# Altium project IoT_SYNTHPATCH_ANALOG.PrjPcb
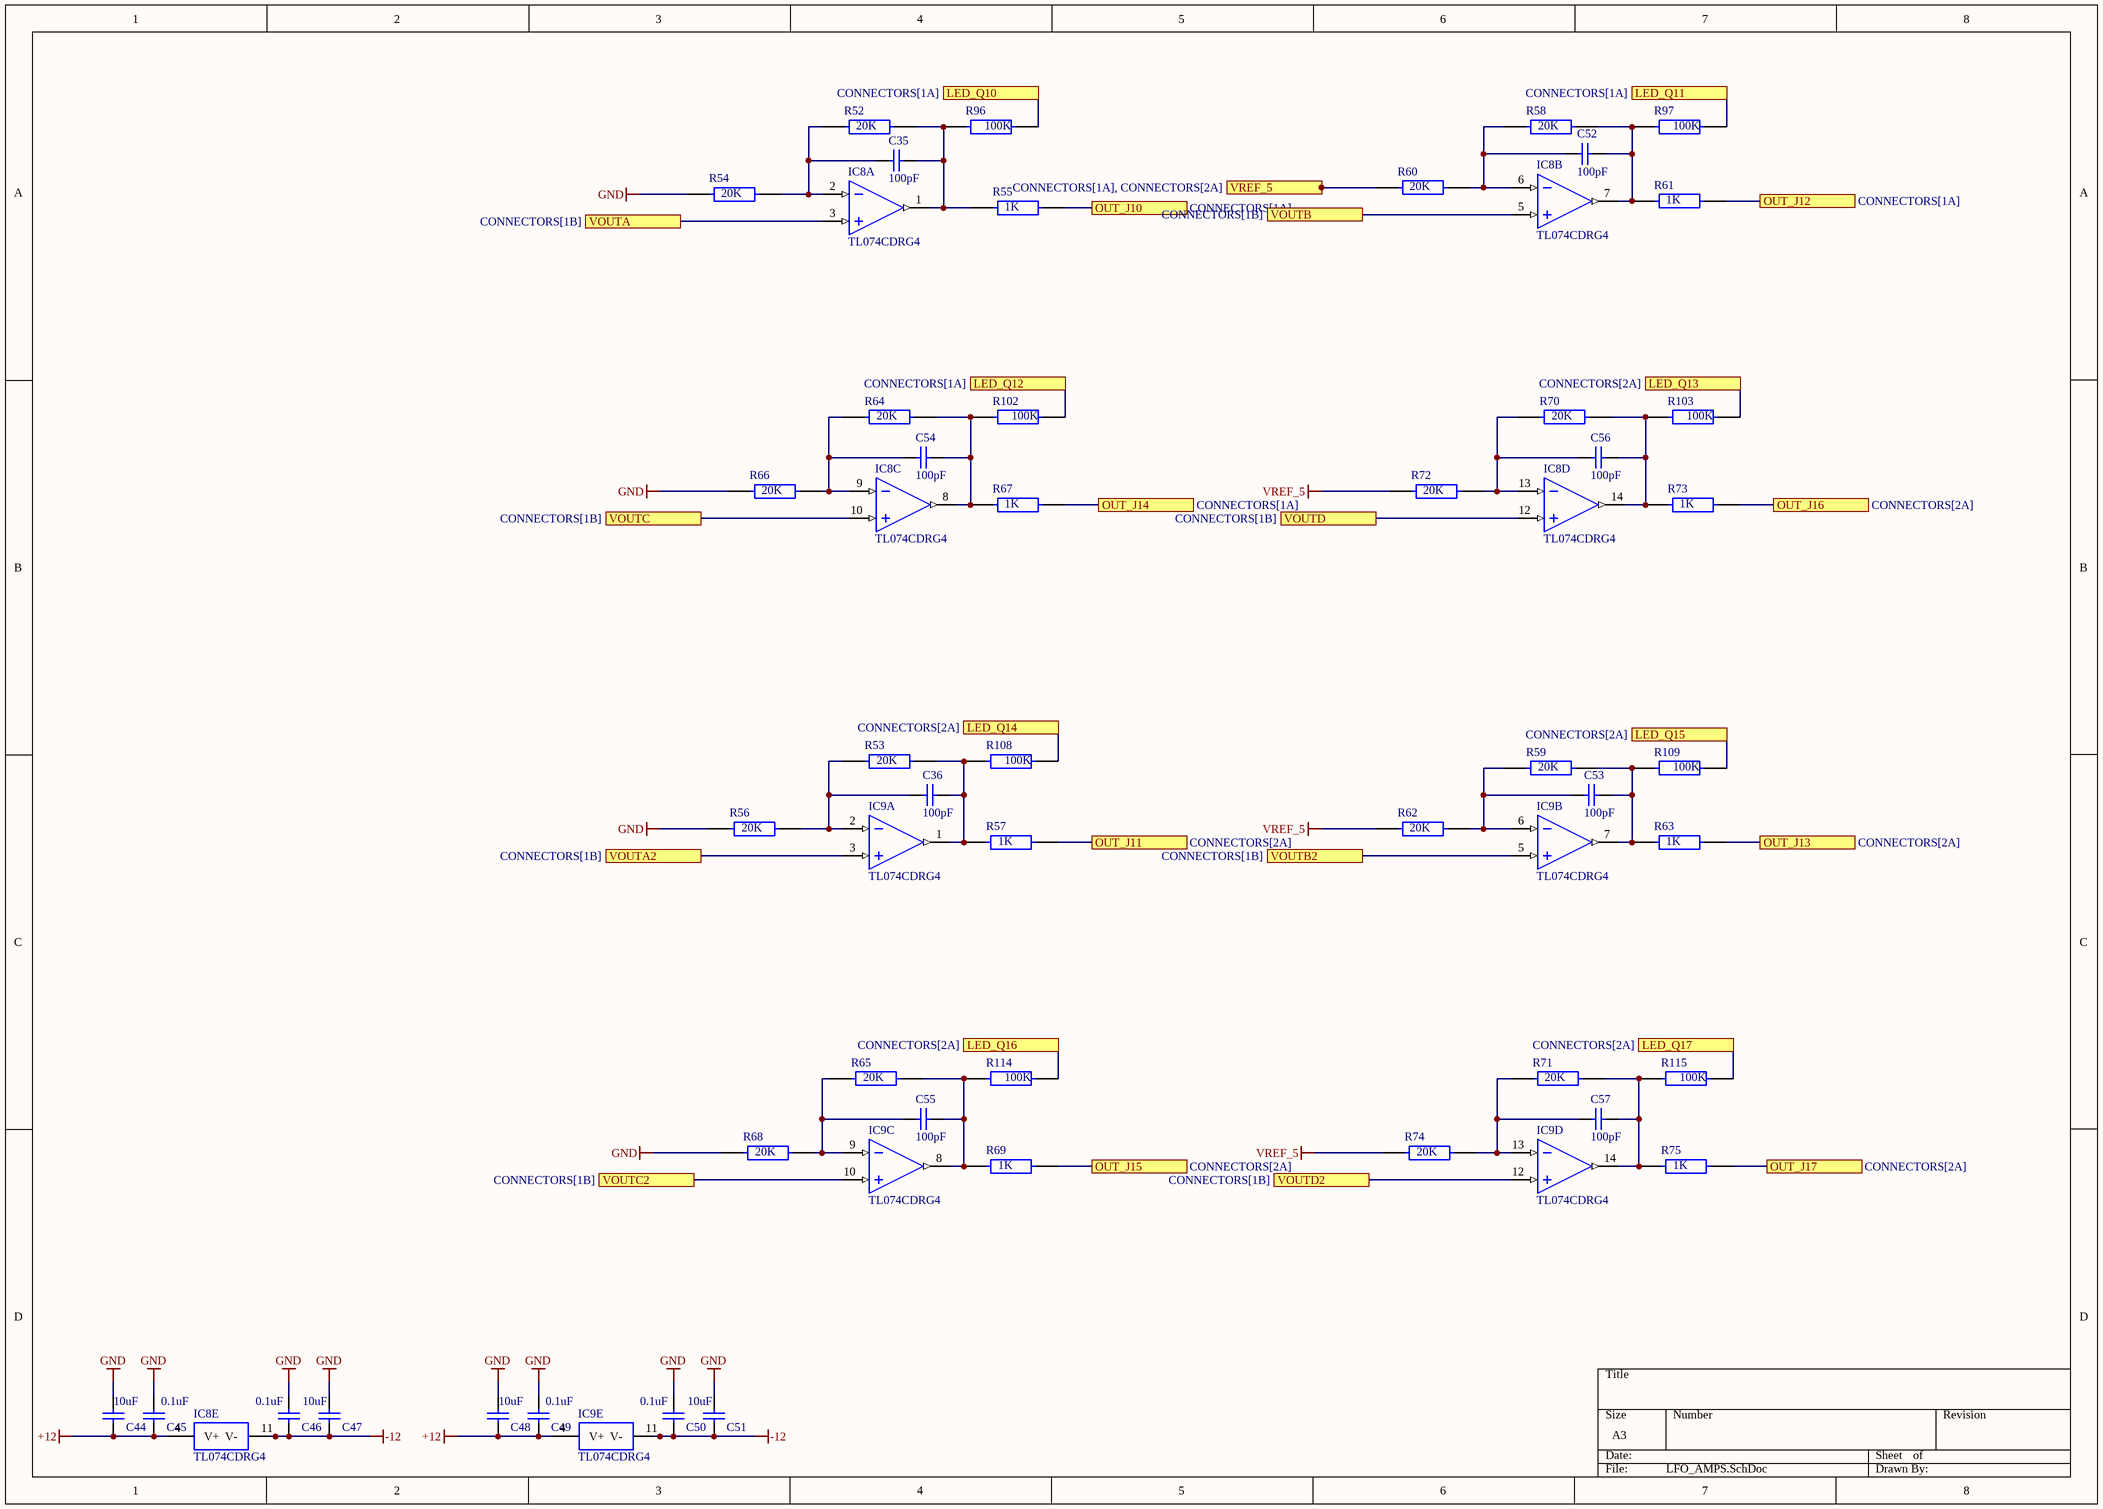
[diagram p0: LFO_AMPS.SchDoc]
8 sheets, 165 parts. Net scope: flat (ports and power ports of the same name join across sheets).
Board file: IoT_SYNTHPATCH_ANALOG.PcbDoc
Sheets:
  LFO_AMPS.SchDoc
  VOCT_AMPS.SchDoc
  ADC_AMPS.SchDoc
  CONNECTORS.SchDoc
  INPUTS_GATES_A.SchDoc
  MENU_BUTTONS_A.SchDoc
  MUTE_BUTTONS_A.SchDoc
  ADC_A.SchDoc

## Sheet LFO_AMPS.SchDoc
size A3; SheetNumber: 1; SheetTotal: 8

### Parts
C35  100pF  [CAPC2013X145X48NL20T23]
C36  100pF  [CAPC2013X145X48NL20T23]
C44  10uF  [CAPC2013X145X48NL20T23]
C45  0.1uF  [CAPC2013X145X48NL20T23]
C46  0.1uF  [CAPC2013X145X48NL20T23]
C47  10uF  [CAPC2013X145X48NL20T23]
C48  10uF  [CAPC2013X145X48NL20T23]
C49  0.1uF  [CAPC2013X145X48NL20T23]
C50  0.1uF  [CAPC2013X145X48NL20T23]
C51  10uF  [CAPC2013X145X48NL20T23]
C52  100pF  [CAPC2013X145X48NL20T23]
C53  100pF  [CAPC2013X145X48NL20T23]
C54  100pF  [CAPC2013X145X48NL20T23]
C55  100pF  [CAPC2013X145X48NL20T23]
C56  100pF  [CAPC2013X145X48NL20T23]
C57  100pF  [CAPC2013X145X48NL20T23]
IC8  TL074CDRG4  [tl074]  (parts A,B,C,D,E of 5)
IC9  TL074CDRG4  [tl074]  (parts A,B,C,D,E of 5)
R52  20K  [FP-RN73R2A-IPC_A]
R53  20K  [FP-RN73R2A-IPC_A]
R54  20K  [FP-RN73R2A-IPC_A]
R55  1K  [FP-RN73R2A-IPC_A]
R56  20K  [FP-RN73R2A-IPC_A]
R57  1K  [FP-RN73R2A-IPC_A]
R58  20K  [FP-RN73R2A-IPC_A]
R59  20K  [FP-RN73R2A-IPC_A]
R60  20K  [FP-RN73R2A-IPC_A]
R61  1K  [FP-RN73R2A-IPC_A]
R62  20K  [FP-RN73R2A-IPC_A]
R63  1K  [FP-RN73R2A-IPC_A]
R64  20K  [FP-RN73R2A-IPC_A]
R65  20K  [FP-RN73R2A-IPC_A]
R66  20K  [FP-RN73R2A-IPC_A]
R67  1K  [FP-RN73R2A-IPC_A]
R68  20K  [FP-RN73R2A-IPC_A]
R69  1K  [FP-RN73R2A-IPC_A]
R70  20K  [FP-RN73R2A-IPC_A]
R71  20K  [FP-RN73R2A-IPC_A]
R72  20K  [FP-RN73R2A-IPC_A]
R73  1K  [FP-RN73R2A-IPC_A]
R74  20K  [FP-RN73R2A-IPC_A]
R75  1K  [FP-RN73R2A-IPC_A]
R96  100K  [FP-RN73R2A-IPC_A]
R97  100K  [FP-RN73R2A-IPC_A]
R102  100K  [FP-RN73R2A-IPC_A]
R103  100K  [FP-RN73R2A-IPC_A]
R108  100K  [FP-RN73R2A-IPC_A]
R109  100K  [FP-RN73R2A-IPC_A]
R114  100K  [FP-RN73R2A-IPC_A]
R115  100K  [FP-RN73R2A-IPC_A]

### Ports
LED_Q10 (see CONNECTORS[1A]), LED_Q11 (see CONNECTORS[1A]), LED_Q12 (see CONNECTORS[1A]), LED_Q13 (see CONNECTORS[2A]), LED_Q14 (see CONNECTORS[2A]), LED_Q15 (see CONNECTORS[2A]), LED_Q16 (see CONNECTORS[2A]), LED_Q17 (see CONNECTORS[2A]), OUT_J10 (see CONNECTORS[1A]), OUT_J11 (see CONNECTORS[2A]), OUT_J12 (see CONNECTORS[1A]), OUT_J13 (see CONNECTORS[2A]), OUT_J14 (see CONNECTORS[1A]), OUT_J15 (see CONNECTORS[2A]), OUT_J16 (see CONNECTORS[2A]), OUT_J17 (see CONNECTORS[2A]), VOUTA2 (see CONNECTORS[1B]), VOUTA (see CONNECTORS[1B]), VOUTB2 (see CONNECTORS[1B]), VOUTB (see CONNECTORS[1B]), VOUTC2 (see CONNECTORS[1B]), VOUTC (see CONNECTORS[1B]), VOUTD2 (see CONNECTORS[1B]), VOUTD (see CONNECTORS[1B]), VREF_5 (see CONNECTORS[1A], CONNECTORS[2A])

### Nets
+12: C44.1 C45.1 C48.1 C49.1 IC8.4(V+) IC9.4(V+)
-12: C46.1 C47.1 C50.1 C51.1 IC8.11(V-) IC9.11(V-)
GND: C44.2 C45.2 C46.2 C47.2 C48.2 C49.2 C50.2 C51.2 R54.1 R56.1 R66.1 R68.1
VREF_5: R60.1 R62.1 R72.1 R74.1 ; port VREF_5
LED_Q10: R96.1 ; port LED_Q10
LED_Q11: R97.1 ; port LED_Q11
LED_Q12: R102.1 ; port LED_Q12
LED_Q13: R103.1 ; port LED_Q13
LED_Q14: R108.1 ; port LED_Q14
LED_Q15: R109.1 ; port LED_Q15
LED_Q16: R114.1 ; port LED_Q16
LED_Q17: R115.1 ; port LED_Q17
OUT_J10: R55.2 ; port OUT_J10
OUT_J11: R57.2 ; port OUT_J11
OUT_J12: R61.2 ; port OUT_J12
OUT_J13: R63.2 ; port OUT_J13
OUT_J14: R67.2 ; port OUT_J14
OUT_J15: R69.2 ; port OUT_J15
OUT_J16: R73.2 ; port OUT_J16
OUT_J17: R75.2 ; port OUT_J17
VOUTA: IC8.3(IN1+) ; port VOUTA
VOUTA2: IC9.3(IN1+) ; port VOUTA2
VOUTB: IC8.5(IN2+) ; port VOUTB
VOUTB2: IC9.5(IN2+) ; port VOUTB2
VOUTC: IC8.10(IN3+) ; port VOUTC
VOUTC2: IC9.10(IN3+) ; port VOUTC2
VOUTD: IC8.12(IN4+) ; port VOUTD
VOUTD2: IC9.12(IN4+) ; port VOUTD2
NetC35_1: C35.1 IC8.1(OUT1) R52.2 R55.1 R96.2
NetC35_2: C35.2 IC8.2(IN1-) R52.1 R54.2
NetC36_1: C36.1 IC9.1(OUT1) R53.2 R57.1 R108.2
NetC36_2: C36.2 IC9.2(IN1-) R53.1 R56.2
NetC52_1: C52.1 IC8.7(OUT2) R58.2 R61.1 R97.2
NetC52_2: C52.2 IC8.6(IN2-) R58.1 R60.2
NetC53_1: C53.1 IC9.7(OUT2) R59.2 R63.1 R109.2
NetC53_2: C53.2 IC9.6(IN2-) R59.1 R62.2
NetC54_1: C54.1 IC8.8(OUT3) R64.2 R67.1 R102.2
NetC54_2: C54.2 IC8.9(IN3-) R64.1 R66.2
NetC55_1: C55.1 IC9.8(OUT3) R65.2 R69.1 R114.2
NetC55_2: C55.2 IC9.9(IN3-) R65.1 R68.2
NetC56_1: C56.1 IC8.14(OUT4) R70.2 R73.1 R103.2
NetC56_2: C56.2 IC8.13(IN4-) R70.1 R72.2
NetC57_1: C57.1 IC9.14(OUT4) R71.2 R75.1 R115.2
NetC57_2: C57.2 IC9.13(IN4-) R71.1 R74.2

### Library data of the parts
C35 C36 C44-C57 = CAP: Manufacturer: Vitramon; Part Number: VJ0805Y682KXAMT
IC8 IC9 = tl074: Quad Low-Noise JFET-Input General-Purpose Operational Amplifier, 7 to 36 V, 0 to 70 degC, 14-pin SOIC (D14), Green (RoHS & no Sb/Br); Manufacturer: Texas Instruments; GBW(Typ)(MHz): 3; Sub Family: General Purpose Amplifier, High Supply Voltage Amplifier (>=30V); Vn at 1kHz(Typ)(nV/rtHz): 18; Rating: Military; Total Supply Voltage(Min)(+5V is 5, +/-5V is 10): 7; IIB(Max)(pA): 200; CMRR(Min)(dB): 70; Number of Channels: 4; Vio (25C)(Max)(mV): 10; Slew Rate(Typ)(V/us): 13; Iq per channel(Max)(mA): 2.5; Total Supply Voltage(Max)(+5V is 5, +/-5V is 10): 36; ComponentLink2URL: http://www.ti.com/lit/ds/symlink/tl074.pdf; ComponentLink3Description: Package Specification; PackageReference: D0014A; ComponentLink1URL: http://www.ti.com/; PartNumber: TL074CDRG4; PackageVersion: 4040047-5/M, 06/2011; Eco-Plan: Green (RoHS & no Sb/Br); PackageDescription: 14-Pin Plastic Small Outline, Body 8.65 x 3.90 mm, Pitch 1.27 mm; Mounting Technology: Surface Mount; ComponentLink1Description: Manufacturer URL; Offset Drift(Typ)(uV/C): 18; ComponentLink3URL: http://www.ti.com/lit/ml/mpds177g/mpds177g.pdf; ComponentLink2Description: Datasheet; DatasheetVersion: SLOS080J; Code_JEDEC: MS-012
R52-R75 R96 R97 R102 R103 R108 R109 R114 R115 = Resistor: RES 10K OHM 0.1% 1/8W 0805

## Sheet VOCT_AMPS.SchDoc
size A4; SheetNumber: 2; SheetTotal: 4
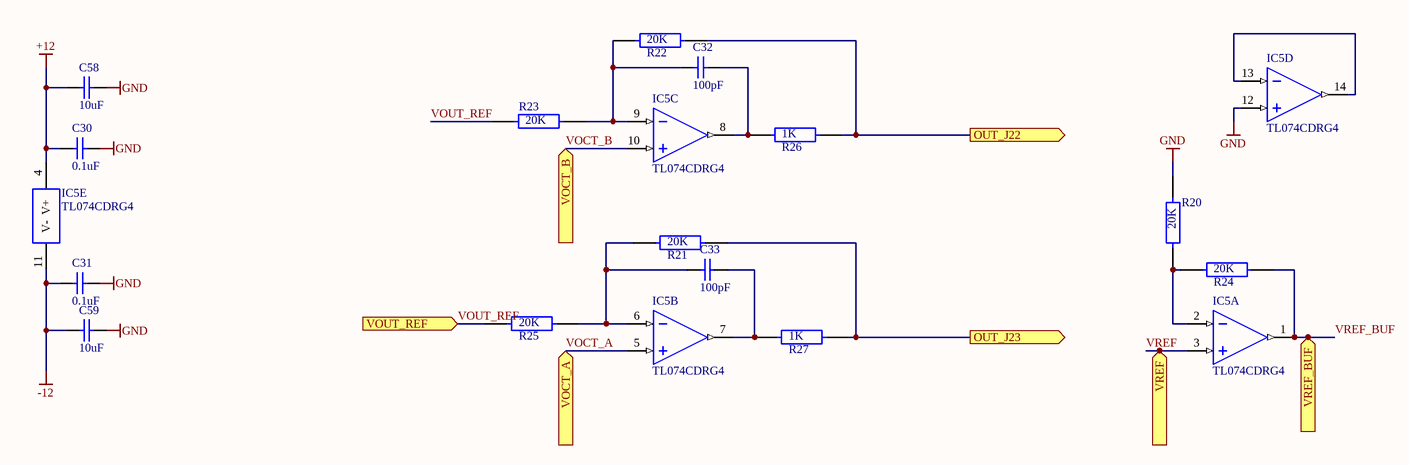
[diagram p1: VOCT_AMPS.SchDoc]

### Parts
C30  0.1uF  [CAPC2013X145X48NL20T23]
C31  0.1uF  [CAPC2013X145X48NL20T23]
C32  100pF  [CAPC2013X145X48NL20T23]
C33  100pF  [CAPC2013X145X48NL20T23]
C58  10uF  [CAPC2013X145X48NL20T23]
C59  10uF  [CAPC2013X145X48NL20T23]
IC5  TL074CDRG4  [tl074]  (parts A,B,C,D,E of 5)
R20  20K  [FP-RN73R2A-IPC_A]
R21  20K  [FP-RN73R2A-IPC_A]
R22  20K  [FP-RN73R2A-IPC_A]
R23  20K  [FP-RN73R2A-IPC_A]
R24  20K  [FP-RN73R2A-IPC_A]
R25  20K  [FP-RN73R2A-IPC_A]
R26  1K  [FP-RN73R2A-IPC_A]
R27  1K  [FP-RN73R2A-IPC_A]

### Ports
OUT_J22, OUT_J23, VOCT_A, VOCT_B, VOUT_REF, VREF, VREF_BUF

### Nets
+12: C30.2 C58.2 IC5.4(V+)
-12: C31.2 C59.2 IC5.11(V-)
GND: C30.1 C31.1 C58.1 C59.1 IC5.12(IN4+) R20.1
OUT_J22: R22.1 R26.1 ; port OUT_J22
OUT_J23: R21.1 R27.1 ; port OUT_J23
VOCT_A: IC5.5(IN2+) ; port VOCT_A
VOCT_B: IC5.10(IN3+) ; port VOCT_B
VOUT_REF: R23.1 R25.2 ; port VOUT_REF
VREF: IC5.3(IN1+) ; port VREF
VREF_BUF: IC5.1(OUT1) R24.1 ; port VREF_BUF
NetC32_1: C32.1 IC5.8(OUT3) R26.2
NetC32_2: C32.2 IC5.9(IN3-) R22.2 R23.2
NetC33_1: C33.1 IC5.7(OUT2) R27.2
NetC33_2: C33.2 IC5.6(IN2-) R21.2 R25.1
NetIC5_2: IC5.2(IN1-) R20.2 R24.2
NetIC5_13: IC5.13(IN4-) IC5.14(OUT4)

### Library data of the parts
C30-C33 C58 C59 = CAP: as C35 on sheet LFO_AMPS
IC5 = tl074: as IC8 on sheet LFO_AMPS; ComponentLink2URL: http://www.ti.com/lit/ds/symlink/tl074.pdf; ComponentLink3Description: Package Specification; PackageReference: D0014A; ComponentLink1URL: http://www.ti.com/; PartNumber: TL074CDRG4; PackageVersion: 4040047-5/M, 06/2011; Eco-Plan: Green (RoHS & no Sb/Br); PackageDescription: 14-Pin Plastic Small Outline, Body 8.65 x 3.90 mm, Pitch 1.27 mm; Mounting Technology: Surface Mount; ComponentLink1Description: Manufacturer URL; Offset Drift(Typ)(uV/C): 18; ComponentLink3URL: http://www.ti.com/lit/ml/mpds177g/mpds177g.pdf; ComponentLink2Description: Datasheet; DatasheetVersion: SLOS080J; Code_JEDEC: MS-012
R20-R27 = Resistor: RES 10K OHM 0.1% 1/8W 0805

## Sheet ADC_AMPS.SchDoc
size A4; SheetNumber: 3; SheetTotal: 4
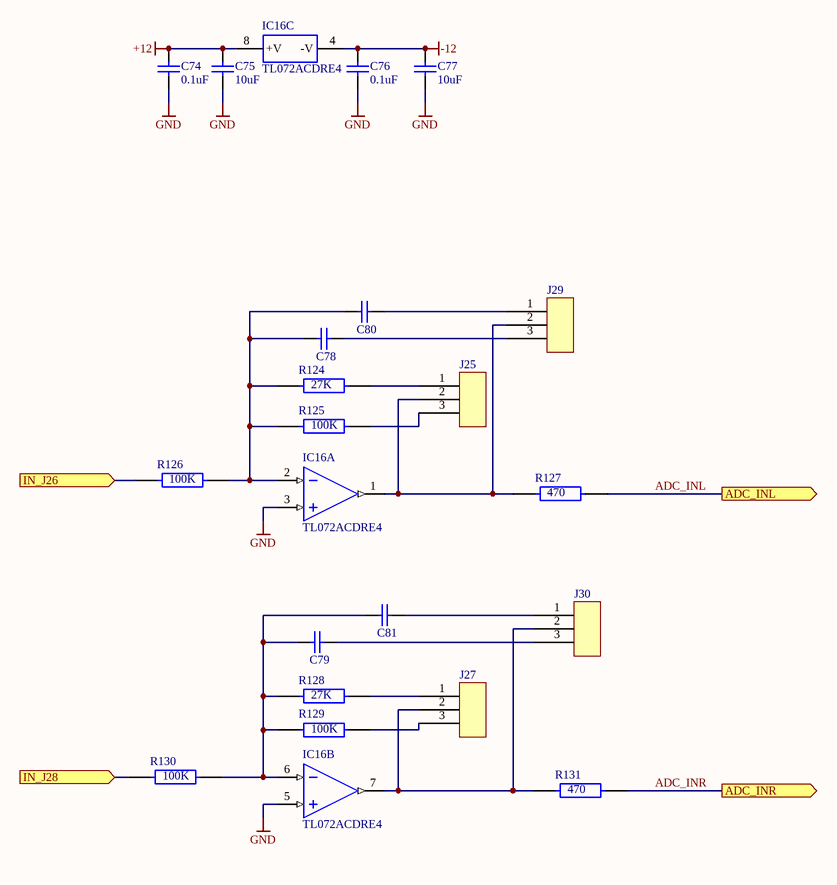
[diagram p2: ADC_AMPS.SchDoc]

### Parts
C74  0.1uF  [CAPC2013X145X48NL20T23]
C75  10uF  [CAPC2013X145X48NL20T23]
C76  0.1uF  [CAPC2013X145X48NL20T23]
C77  10uF  [CAPC2013X145X48NL20T23]
C78  270pF  [CAPC2013X145X48NL20T23]  (value not drawn)
C79  270pF  [CAPC2013X145X48NL20T23]  (value not drawn)
C80  68pF  [CAPC2013X145X48NL20T23]  (value not drawn)
C81  68pF  [CAPC2013X145X48NL20T23]  (value not drawn)
IC16  TL072ACDRE4  [tl072]  (parts A,B,C of 3)
J25  Pinheader_1x3  [HDR_1x3_P2.54]  (value not drawn)
J27  Pinheader_1x3  [HDR_1x3_P2.54]  (value not drawn)
J29  Pinheader_1x3  [HDR_1x3_P2.54]  (value not drawn)
J30  Pinheader_1x3  [HDR_1x3_P2.54]  (value not drawn)
R124  27K  [FP-RN73R2A-IPC_A]
R125  100K  [FP-RN73R2A-IPC_A]
R126  100K  [FP-RN73R2A-IPC_A]
R127  470  [FP-RN73R2A-IPC_A]
R128  27K  [FP-RN73R2A-IPC_A]
R129  100K  [FP-RN73R2A-IPC_A]
R130  100K  [FP-RN73R2A-IPC_A]
R131  470  [FP-RN73R2A-IPC_A]

### Ports
ADC_INL, ADC_INR, IN_J26, IN_J28

### Nets
+12: C74.1 C75.1 IC16.8(+V)
-12: C76.1 C77.1 IC16.4(-V)
GND: C74.2 C75.2 C76.2 C77.2 IC16.3(IN1+) IC16.5(IN2+)
ADC_INL: R127.2 ; port ADC_INL
ADC_INR: R131.2 ; port ADC_INR
IN_J26: R126.1 ; port IN_J26
IN_J28: R130.1 ; port IN_J28
NetC78_1: C78.1 C80.1 IC16.2(IN1-) R124.1 R125.1 R126.2
NetC78_2: C78.2 J29.3
NetC79_1: C79.1 C81.1 IC16.6(IN2-) R128.1 R129.1 R130.2
NetC79_2: C79.2 J30.3
NetC80_2: C80.2 J29.1
NetC81_2: C81.2 J30.1
NetIC16_1: IC16.1(OUT1) J25.2 J29.2 R127.1
NetIC16_7: IC16.7(OUT2) J27.2 J30.2 R131.1
NetJ25_1: J25.1 R124.2
NetJ25_3: J25.3 R125.2
NetJ27_1: J27.1 R128.2
NetJ27_3: J27.3 R129.2

### Library data of the parts
C74-C81 = CAP: as C35 on sheet LFO_AMPS
IC16 = tl072: Low-Noise JFET-Input Operational Amplifier, 7 to 36 V, 0 to 70 degC, 8-pin SOIC (D8), Green (RoHS & no Sb/Br); Manufacturer: Texas Instruments; Vn at 1kHz(Typ)(nV/rtHz): 18; Slew Rate(Typ)(V/us): 13; Rating: Catalog; CMRR(Min)(dB): 75; Total Supply Voltage(Max)(+5V is 5, +/-5V is 10): 36; GBW(Typ)(MHz): 3; Sub Family: General Purpose Amplifier, High Supply Voltage Amplifier (>=30V); Vio (25C)(Max)(mV): 6; Total Supply Voltage(Min)(+5V is 5, +/-5V is 10): 7; Iq per channel(Max)(mA): 2.5; IIB(Max)(pA): 200; Number of Channels: 2; ComponentLink1Description: Manufacturer URL; DatasheetVersion: SLOS080J; ComponentLink1URL: http://www.ti.com/; Eco-Plan: Green (RoHS & no Sb/Br); PackageDescription: 8-Pin Plastic Small Outline, Body 4.9 x 3.9 mm, Pitch 1.27 mm; PackageVersion: 4040047-3/M, 06/2011; Offset Drift(Typ)(uV/C): 18; Mounting Technology: Surface Mount; PackageReference: D8; ComponentLink2Description: Datasheet; ComponentLink3URL: http://www.ti.com/litv/pdf/msoi002j; Code_JEDEC: MS-012; ComponentLink3Description: Package Specification; ComponentLink2URL: http://www.ti.com/lit/ds/symlink/tl072a.pdf; PartNumber: TL072ACDRE4
R124-R131 = Resistor: RES 10K OHM 0.1% 1/8W 0805

## Sheet CONNECTORS.SchDoc
size A4; SheetNumber: 4; SheetTotal: 8
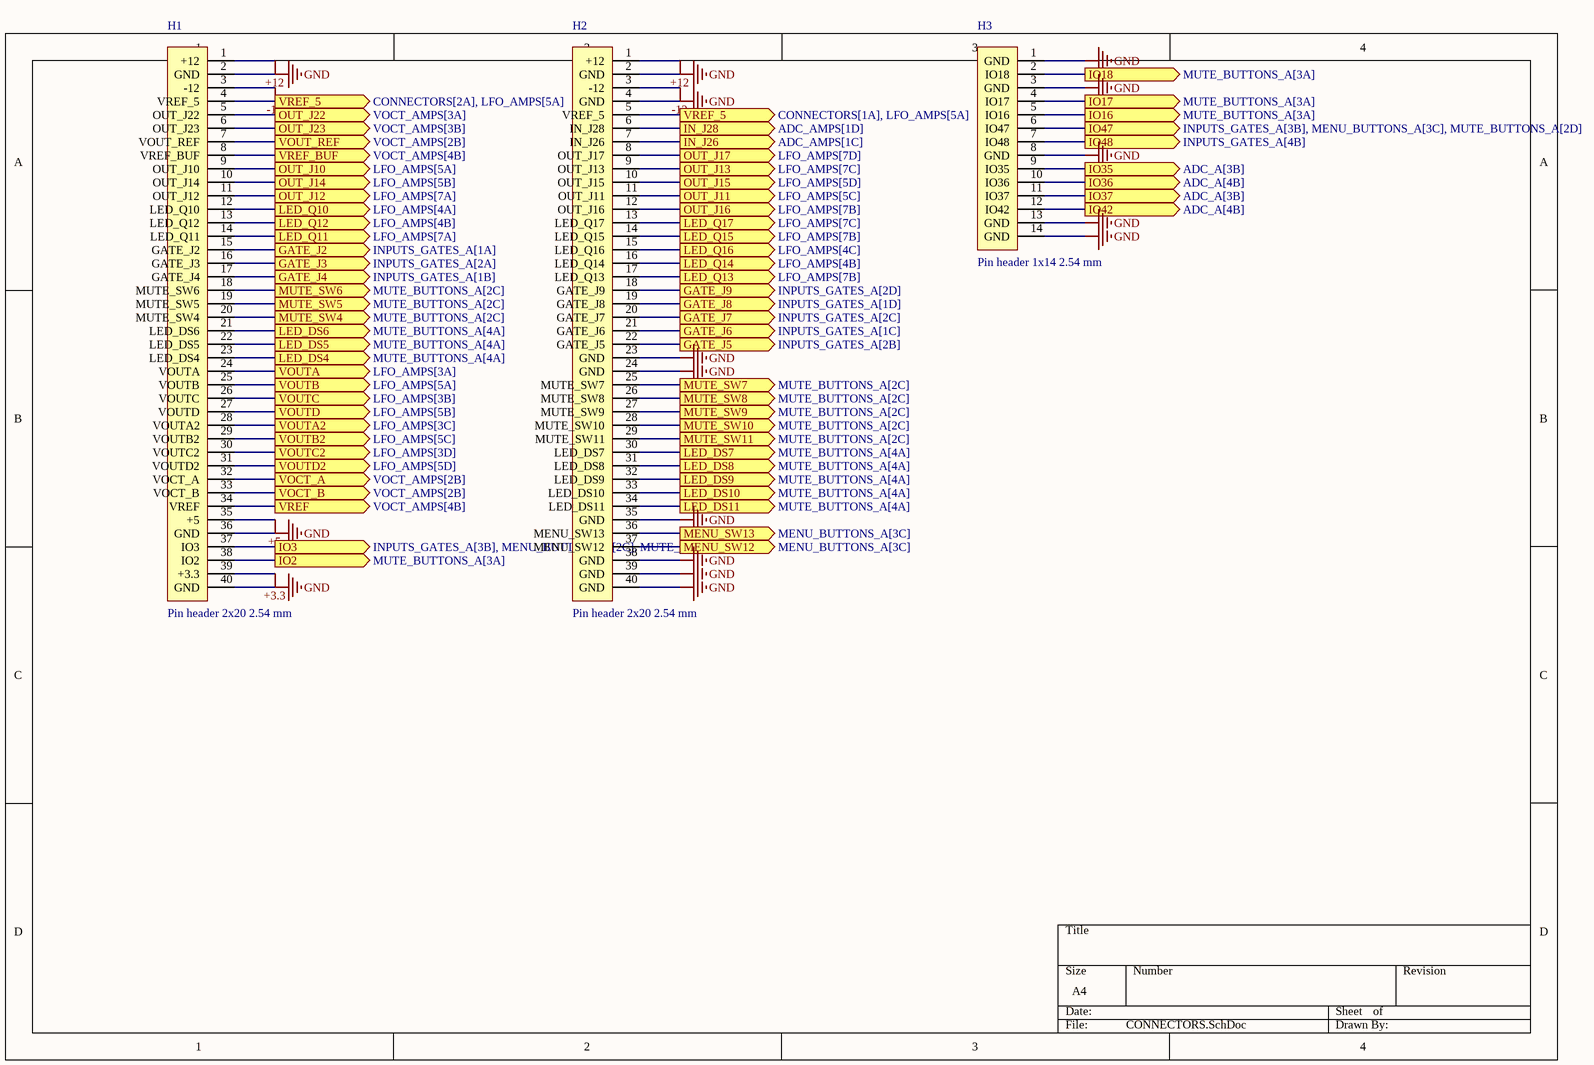
[diagram p3: CONNECTORS.SchDoc]

### Parts
H1  Pin header 2x20 2.54 mm  [HDR_2x20_P2.54]
H2  Pin header 2x20 2.54 mm  [HDR_2x20_P2.54]
H3  Pin header 1x14 2.54 mm  [HDR_1x14_P2.54]

### Ports
GATE_J2 (see INPUTS_GATES_A[1A]), GATE_J3 (see INPUTS_GATES_A[2A]), GATE_J4 (see INPUTS_GATES_A[1B]), GATE_J5 (see INPUTS_GATES_A[2B]), GATE_J6 (see INPUTS_GATES_A[1C]), GATE_J7 (see INPUTS_GATES_A[2C]), GATE_J8 (see INPUTS_GATES_A[1D]), GATE_J9 (see INPUTS_GATES_A[2D]), IN_J26 (see ADC_AMPS[1C]), IN_J28 (see ADC_AMPS[1D]), IO2 (see MUTE_BUTTONS_A[3A]), IO3 (see INPUTS_GATES_A[3B], MENU_BUTTONS_A[2C], MUTE_BUTTONS_A[2C]), IO16 (see MUTE_BUTTONS_A[3A]), IO17 (see MUTE_BUTTONS_A[3A]), IO18 (see MUTE_BUTTONS_A[3A]), IO35 (see ADC_A[3B]), IO36 (see ADC_A[4B]), IO37 (see ADC_A[3B]), IO42 (see ADC_A[4B]), IO47 (see INPUTS_GATES_A[3B], MENU_BUTTONS_A[3C], MUTE_BUTTONS_A[2D]), IO48 (see INPUTS_GATES_A[4B]), LED_DS4 (see MUTE_BUTTONS_A[4A]), LED_DS5 (see MUTE_BUTTONS_A[4A]), LED_DS6 (see MUTE_BUTTONS_A[4A]), LED_DS7 (see MUTE_BUTTONS_A[4A]), LED_DS8 (see MUTE_BUTTONS_A[4A]), LED_DS9 (see MUTE_BUTTONS_A[4A]), LED_DS10 (see MUTE_BUTTONS_A[4A]), LED_DS11 (see MUTE_BUTTONS_A[4A]), LED_Q10 (see LFO_AMPS[4A]), LED_Q11 (see LFO_AMPS[7A]), LED_Q12 (see LFO_AMPS[4B]), LED_Q13 (see LFO_AMPS[7B]), LED_Q14 (see LFO_AMPS[4B]), LED_Q15 (see LFO_AMPS[7B]), LED_Q16 (see LFO_AMPS[4C]), LED_Q17 (see LFO_AMPS[7C]), MENU_SW12 (see MENU_BUTTONS_A[3C]), MENU_SW13 (see MENU_BUTTONS_A[3C]), MUTE_SW4 (see MUTE_BUTTONS_A[2C]), MUTE_SW5 (see MUTE_BUTTONS_A[2C]), MUTE_SW6 (see MUTE_BUTTONS_A[2C]), MUTE_SW7 (see MUTE_BUTTONS_A[2C]), MUTE_SW8 (see MUTE_BUTTONS_A[2C]), MUTE_SW9 (see MUTE_BUTTONS_A[2C]), MUTE_SW10 (see MUTE_BUTTONS_A[2C]), MUTE_SW11 (see MUTE_BUTTONS_A[2C]), OUT_J10 (see LFO_AMPS[5A]), OUT_J11 (see LFO_AMPS[5C]), OUT_J12 (see LFO_AMPS[7A]), OUT_J13 (see LFO_AMPS[7C]), OUT_J14 (see LFO_AMPS[5B]), OUT_J15 (see LFO_AMPS[5D]), OUT_J16 (see LFO_AMPS[7B]), OUT_J17 (see LFO_AMPS[7D]), OUT_J22 (see VOCT_AMPS[3A]), OUT_J23 (see VOCT_AMPS[3B]), VOCT_A (see VOCT_AMPS[2B]), VOCT_B (see VOCT_AMPS[2B]), VOUT_REF (see VOCT_AMPS[2B]), VOUTA2 (see LFO_AMPS[3C]), VOUTA (see LFO_AMPS[3A]), VOUTB2 (see LFO_AMPS[5C]), VOUTB (see LFO_AMPS[5A]), VOUTC2 (see LFO_AMPS[3D]), VOUTC (see LFO_AMPS[3B]), VOUTD2 (see LFO_AMPS[5D]), VOUTD (see LFO_AMPS[5B]), VREF (see VOCT_AMPS[4B]), VREF_5 (see CONNECTORS[1A], LFO_AMPS[5A]), VREF_5 (see CONNECTORS[2A], LFO_AMPS[5A]), VREF_BUF (see VOCT_AMPS[4B])

### Nets
+3.3: H1.39(+3.3)
+5: H1.35(+5)
+12: H1.1(+12) H2.1(+12)
-12: H1.3(-12) H2.3(-12)
GND: H1.2(GND) H1.36(GND) H1.40(GND) H2.2(GND) H2.4(GND) H2.23(GND) H2.24(GND) H2.35(GND) H2.38(GND) H2.39(GND) H2.40(GND) H3.1(GND) H3.3(GND) H3.8(GND) H3.13(GND) H3.14(GND)
VREF_5: H1.4(VREF_5) H2.5(VREF_5) ; port VREF_5
D0_L: H1.20(MUTE_SW4) ; port MUTE_SW4
D0_M: H2.37(MENU_SW12) ; port MENU_SW12
D1_L: H1.19(MUTE_SW5) ; port MUTE_SW5
D1_M: H2.36(MENU_SW13) ; port MENU_SW13
D2_L: H1.18(MUTE_SW6) ; port MUTE_SW6
D3_L: H2.25(MUTE_SW7) ; port MUTE_SW7
D4_L: H2.26(MUTE_SW8) ; port MUTE_SW8
D5_L: H2.27(MUTE_SW9) ; port MUTE_SW9
D6_L: H2.28(MUTE_SW10) ; port MUTE_SW10
D7_L: H2.29(MUTE_SW11) ; port MUTE_SW11
GATE_J2: H1.15(GATE_J2) ; port GATE_J2
GATE_J3: H1.16(GATE_J3) ; port GATE_J3
GATE_J4: H1.17(GATE_J4) ; port GATE_J4
GATE_J5: H2.22(GATE_J5) ; port GATE_J5
GATE_J6: H2.21(GATE_J6) ; port GATE_J6
GATE_J7: H2.20(GATE_J7) ; port GATE_J7
GATE_J8: H2.19(GATE_J8) ; port GATE_J8
GATE_J9: H2.18(GATE_J9) ; port GATE_J9
IN_J26: H2.7(IN_J26) ; port IN_J26
IN_J28: H2.6(IN_J28) ; port IN_J28
IO2: H1.38(IO2) ; port IO2
IO3: H1.37(IO3) ; port IO3
IO16: H3.5(IO16) ; port IO16
IO17: H3.4(IO17) ; port IO17
IO18: H3.2(IO18) ; port IO18
IO35: H3.9(IO35) ; port IO35
IO36: H3.10(IO36) ; port IO36
IO37: H3.11(IO37) ; port IO37
IO42: H3.12(IO42) ; port IO42
IO47: H3.6(IO47) ; port IO47
IO48: H3.7(IO48) ; port IO48
LED_DS4: H1.23(LED_DS4) ; port LED_DS4
LED_DS5: H1.22(LED_DS5) ; port LED_DS5
LED_DS6: H1.21(LED_DS6) ; port LED_DS6
LED_DS7: H2.30(LED_DS7) ; port LED_DS7
LED_DS8: H2.31(LED_DS8) ; port LED_DS8
LED_DS9: H2.32(LED_DS9) ; port LED_DS9
LED_DS10: H2.33(LED_DS10) ; port LED_DS10
LED_DS11: H2.34(LED_DS11) ; port LED_DS11
LED_Q10: H1.12(LED_Q10) ; port LED_Q10
LED_Q11: H1.14(LED_Q11) ; port LED_Q11
LED_Q12: H1.13(LED_Q12) ; port LED_Q12
LED_Q13: H2.17(LED_Q13) ; port LED_Q13
LED_Q14: H2.16(LED_Q14) ; port LED_Q14
LED_Q15: H2.14(LED_Q15) ; port LED_Q15
LED_Q16: H2.15(LED_Q16) ; port LED_Q16
LED_Q17: H2.13(LED_Q17) ; port LED_Q17
OUT_J10: H1.9(OUT_J10) ; port OUT_J10
OUT_J11: H2.11(OUT_J11) ; port OUT_J11
OUT_J12: H1.11(OUT_J12) ; port OUT_J12
OUT_J13: H2.9(OUT_J13) ; port OUT_J13
OUT_J14: H1.10(OUT_J14) ; port OUT_J14
OUT_J15: H2.10(OUT_J15) ; port OUT_J15
OUT_J16: H2.12(OUT_J16) ; port OUT_J16
OUT_J17: H2.8(OUT_J17) ; port OUT_J17
OUT_J22: H1.5(OUT_J22) ; port OUT_J22
OUT_J23: H1.6(OUT_J23) ; port OUT_J23
VOCT_A: H1.32(VOCT_A) ; port VOCT_A
VOCT_B: H1.33(VOCT_B) ; port VOCT_B
VOUT_REF: H1.7(VOUT_REF) ; port VOUT_REF
VOUTA: H1.24(VOUTA) ; port VOUTA
VOUTA2: H1.28(VOUTA2) ; port VOUTA2
VOUTB: H1.25(VOUTB) ; port VOUTB
VOUTB2: H1.29(VOUTB2) ; port VOUTB2
VOUTC: H1.26(VOUTC) ; port VOUTC
VOUTC2: H1.30(VOUTC2) ; port VOUTC2
VOUTD: H1.27(VOUTD) ; port VOUTD
VOUTD2: H1.31(VOUTD2) ; port VOUTD2
VREF: H1.34(VREF) ; port VREF
VREF_BUF: H1.8(VREF_BUF) ; port VREF_BUF

### Library data of the parts
H1 H2 = Header_2x20
H3 = Header_1x14

## Sheet INPUTS_GATES_A.SchDoc
size A4; SheetNumber: 5; SheetTotal: 6
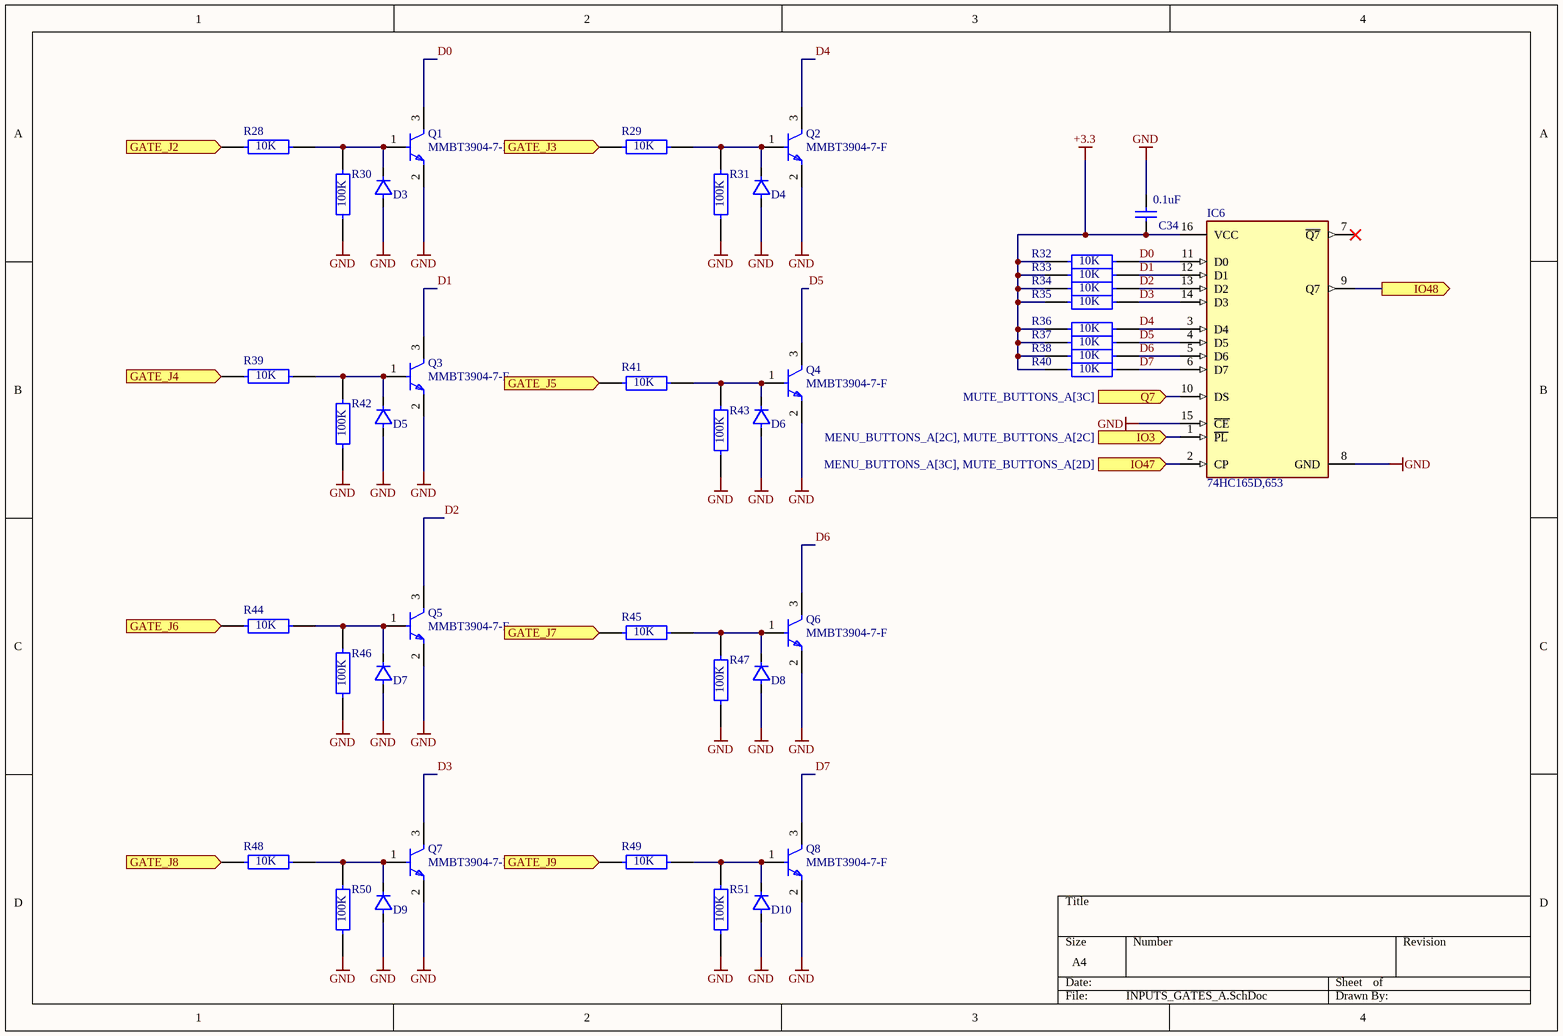
[diagram p4: INPUTS_GATES_A.SchDoc]

### Parts
C34  0.1uF  [CAPC2013X145X48NL20T23]
D3  1N4148WS  [4148]  (value not drawn)
D4  1N4148WS  [4148]  (value not drawn)
D5  1N4148WS  [4148]  (value not drawn)
D6  1N4148WS  [4148]  (value not drawn)
D7  1N4148WS  [4148]  (value not drawn)
D8  1N4148WS  [4148]  (value not drawn)
D9  1N4148WS  [4148]  (value not drawn)
D10  1N4148WS  [4148]  (value not drawn)
IC6  74HC165D,653  [FP-SOT109-1-MFG]
Q1  MMBT3904-7-F  [3904-SOT23]
Q2  MMBT3904-7-F  [3904-SOT23]
Q3  MMBT3904-7-F  [3904-SOT23]
Q4  MMBT3904-7-F  [3904-SOT23]
Q5  MMBT3904-7-F  [3904-SOT23]
Q6  MMBT3904-7-F  [3904-SOT23]
Q7  MMBT3904-7-F  [3904-SOT23]
Q8  MMBT3904-7-F  [3904-SOT23]
R28  10K  [FP-RN73R2A-IPC_A]
R29  10K  [FP-RN73R2A-IPC_A]
R30  100K  [FP-RN73R2A-IPC_A]
R31  100K  [FP-RN73R2A-IPC_A]
R32  10K  [FP-RN73R2A-IPC_A]
R33  10K  [FP-RN73R2A-IPC_A]
R34  10K  [FP-RN73R2A-IPC_A]
R35  10K  [FP-RN73R2A-IPC_A]
R36  10K  [FP-RN73R2A-IPC_A]
R37  10K  [FP-RN73R2A-IPC_A]
R38  10K  [FP-RN73R2A-IPC_A]
R39  10K  [FP-RN73R2A-IPC_A]
R40  10K  [FP-RN73R2A-IPC_A]
R41  10K  [FP-RN73R2A-IPC_A]
R42  100K  [FP-RN73R2A-IPC_A]
R43  100K  [FP-RN73R2A-IPC_A]
R44  10K  [FP-RN73R2A-IPC_A]
R45  10K  [FP-RN73R2A-IPC_A]
R46  100K  [FP-RN73R2A-IPC_A]
R47  100K  [FP-RN73R2A-IPC_A]
R48  10K  [FP-RN73R2A-IPC_A]
R49  10K  [FP-RN73R2A-IPC_A]
R50  100K  [FP-RN73R2A-IPC_A]
R51  100K  [FP-RN73R2A-IPC_A]

### Ports
GATE_J2, GATE_J3, GATE_J4, GATE_J5, GATE_J6, GATE_J7, GATE_J8, GATE_J9, IO3 (in, see MENU_BUTTONS_A[2C], MUTE_BUTTONS_A[2C]), IO47 (in, see MENU_BUTTONS_A[3C], MUTE_BUTTONS_A[2D]), IO48 (out), Q7 (in, see MUTE_BUTTONS_A[3C])

### Nets
+3.3: C34.1 IC6.16(VCC) R32.1 R33.1 R34.1 R35.1 R36.1 R37.1 R38.1 R40.1
GND: C34.2 D3.2(A) D4.2(A) D5.2(A) D6.2(A) D7.2(A) D8.2(A) D9.2(A) D10.2(A) IC6.8(GND) IC6.15(~{CE}) Q1.2(E) Q2.2(E) Q3.2(E) Q4.2(E) Q5.2(E) Q6.2(E) Q7.2(E) Q8.2(E) R30.1 R31.1 R42.1 R43.1 R46.1 R47.1 R50.1 R51.1
D0: IC6.11(D0) Q1.3(C) R32.2
D1: IC6.12(D1) Q3.3(C) R33.2
D2: IC6.13(D2) Q5.3(C) R34.2
D3: IC6.14(D3) Q7.3(C) R35.2
D4: IC6.3(D4) Q2.3(C) R36.2
D5: IC6.4(D5) Q4.3(C) R37.2
D6: IC6.5(D6) Q6.3(C) R38.2
D7: IC6.6(D7) Q8.3(C) R40.2
GATE_J2: R28.1 ; port GATE_J2
GATE_J3: R29.1 ; port GATE_J3
GATE_J4: R39.1 ; port GATE_J4
GATE_J5: R41.1 ; port GATE_J5
GATE_J6: R44.1 ; port GATE_J6
GATE_J7: R45.1 ; port GATE_J7
GATE_J8: R48.1 ; port GATE_J8
GATE_J9: R49.1 ; port GATE_J9
IO3: IC6.1(~{PL}) ; port IO3
IO47: IC6.2(CP) ; port IO47
IO48: IC6.9(Q7) ; port IO48
Q7: IC6.10(DS) ; port Q7
NetD3_1: D3.1(C) Q1.1(B) R28.2 R30.2
NetD4_1: D4.1(C) Q2.1(B) R29.2 R31.2
NetD5_1: D5.1(C) Q3.1(B) R39.2 R42.2
NetD6_1: D6.1(C) Q4.1(B) R41.2 R43.2
NetD7_1: D7.1(C) Q5.1(B) R44.2 R46.2
NetD8_1: D8.1(C) Q6.1(B) R45.2 R47.2
NetD9_1: D9.1(C) Q7.1(B) R48.2 R50.2
NetD10_1: D10.1(C) Q8.1(B) R49.2 R51.2

Not connected (* = marked no-connect by the designer): IC6 7(~{Q7})*

### Library data of the parts
C34 = CAP: as C35 on sheet LFO_AMPS
D3-D10 = 4148WS: DIODE GEN PURP 75V 150MA SOD323F; Forward Voltage: 1V; Power Dissipation: 200mW; Element Configuration: Single; Max Forward Surge Current (Ifsm): 2A; Peak Reverse Current: 5uA; Recovery Time: 4ns; Package Quantity: 1; Number of Pins: 2; Height: 1mm; REACH SVHC: No SVHC; Max Reverse Voltage (DC): 75V; Forward Current: 150mA; Length: 1.8mm; Max Repetitive Reverse Voltage (Vrrm): 75V; Max Operating Temperature: 150°C; Average Rectified Current: 150mA; Contact Plating: Tin; Packaging: Tape and Reel; Radiation Hardening: No; Min Operating Temperature: -55°C; Width: 1.35mm; Weight: 0.0276g; Lead Free: Lead Free; Mount: Surface Mount; Reverse Voltage: 75V; Reverse Recovery Time: 4ns
IC6 = 74HC165: IC SHIFT REGST 8BIT PI-SO 16SOIC; Manufacturer: Nexperia; Standoff Height: 0.1mm; Number Of Inputs: 8; Logic Function Desc: Shift Register; Nominal Supply Current: 8uA; Number Of Circuits: 1; Propagation Delay: 15ns; Min Supply Voltage: 2V; Frequency: 61MHz; Max Supply Voltage: 6V; Height: 1.75mm; Digikey Description: IC SHIFT REGST 8BIT PI-SO 16SOIC; ComponentLink2URL: https://assets.nexperia.com/documents/data-sheet/74HC_HCT165.pdf; Ipc Land Pattern Name: SOP127P600X175-16; Temperature Range High: +125°C; Manufacturer Part Number: 74HC165D,653; Temperature: -40°C to +125°C; Device Class L2: Logic ICs; Device Class L1: Integrated Circuits (ICs); Lead Free: Yes; Number Of Outputs: 1; Ambient Temperature Range High: +125°C; ComponentLink2Description: Datasheet; Temperature Range Low: -40°C; Category: IC; RoHS: TRUE; Automotive: No; Device Class L3: Shift Registers; Octopart: https://octopart.com/74hc165d%2C653-nexperia-78737091; Footprint Url: https://assets.nexperia.com/documents/outline-drawing/SOT109-1.pdf; Ambient Temperature Range Low: -40°C; Package: SOT109-1
Q1-Q8 = 3904: TRANS NPN 40V 0.2A SMD SOT23-3; Frequency: 300MHz; Power Dissipation: 350mW; Element Configuration: Single; Max Power Dissipation: 300mW; Max Collector Current: 200mA; Collector Emitter Saturation Voltage: 300mV; Number of Elements: 1; hFE Min: 100; Collector Base Voltage (VCBO): 60V; Emitter Base Voltage (VEBO): 6V; Contact Plating: Tin; Package Quantity: 3000; Max Frequency: 300MHz; REACH SVHC: No SVHC; Max Operating Temperature: 150°C; Width: 1.4mm; Collector Emitter Voltage (VCEO): 40V; Voltage Rating (DC): 40V; Radiation Hardening: No; Case/Package: SOT-23; Height: 1mm; Collector Emitter Breakdown Voltage: 40V; Length: 3.05mm; Polarity: NPN; Packaging: Tape and Reel; Number of Pins: 3; Min Operating Temperature: -55°C; Gain Bandwidth Product: 300MHz; Mount: Surface Mount; Weight: 0.000282oz; Continuous Collector Current: 200mA; Transition Frequency: 300MHz; Max Breakdown Voltage: 40V; Lead Free: Lead Free
R28-R51 = Resistor: RES 10K OHM 0.1% 1/8W 0805

## Sheet MENU_BUTTONS_A.SchDoc
size A4; SheetNumber: 6; SheetTotal: 7
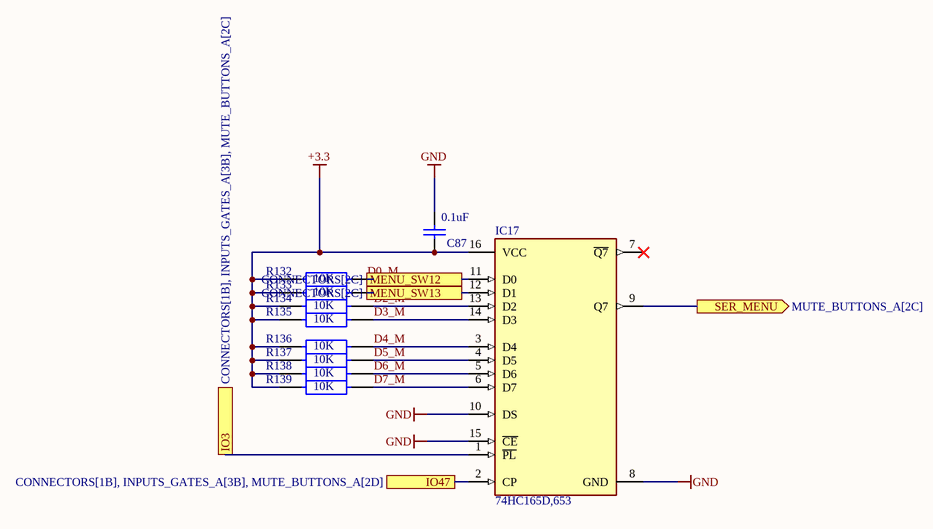
[diagram p5: MENU_BUTTONS_A.SchDoc]

### Parts
C87  0.1uF  [CAPC2013X145X48NL20T23]
IC17  74HC165D,653  [FP-SOT109-1-MFG]
R132  10K  [FP-RN73R2A-IPC_A]
R133  10K  [FP-RN73R2A-IPC_A]
R134  10K  [FP-RN73R2A-IPC_A]
R135  10K  [FP-RN73R2A-IPC_A]
R136  10K  [FP-RN73R2A-IPC_A]
R137  10K  [FP-RN73R2A-IPC_A]
R138  10K  [FP-RN73R2A-IPC_A]
R139  10K  [FP-RN73R2A-IPC_A]

### Ports
IO3 (see CONNECTORS[1B], INPUTS_GATES_A[3B], MUTE_BUTTONS_A[2C]), IO47 (see CONNECTORS[1B], INPUTS_GATES_A[3B], MUTE_BUTTONS_A[2D]), MENU_SW12 (see CONNECTORS[2C]), MENU_SW13 (see CONNECTORS[2C]), SER_MENU (out, see MUTE_BUTTONS_A[2C])

### Nets
+3.3: C87.1 IC17.16(VCC) R132.1 R133.1 R134.1 R135.1 R136.1 R137.1 R138.1 R139.1
GND: C87.2 IC17.8(GND) IC17.10(DS) IC17.15(~{CE})
D0_M: IC17.11(D0) R132.2 ; port MENU_SW12
D1_M: IC17.12(D1) R133.2 ; port MENU_SW13
D2_M: IC17.13(D2) R134.2
D3_M: IC17.14(D3) R135.2
D4_M: IC17.3(D4) R136.2
D5_M: IC17.4(D5) R137.2
D6_M: IC17.5(D6) R138.2
D7_M: IC17.6(D7) R139.2
IO3: IC17.1(~{PL}) ; port IO3
IO47: IC17.2(CP) ; port IO47
SER_MENU: IC17.9(Q7) ; port SER_MENU

Not connected (* = marked no-connect by the designer): IC17 7(~{Q7})*

### Library data of the parts
C87 = CAP: as C35 on sheet LFO_AMPS
IC17 = 74HC165: as IC6 on sheet INPUTS_GATES_A; Height: 1.75mm; Digikey Description: IC SHIFT REGST 8BIT PI-SO 16SOIC; ComponentLink2URL: https://assets.nexperia.com/documents/data-sheet/74HC_HCT165.pdf; Ipc Land Pattern Name: SOP127P600X175-16; Temperature Range High: +125°C; Manufacturer Part Number: 74HC165D,653; Temperature: -40°C to +125°C; Device Class L2: Logic ICs; Device Class L1: Integrated Circuits (ICs); Lead Free: Yes; Number Of Outputs: 1; Ambient Temperature Range High: +125°C; ComponentLink2Description: Datasheet; Temperature Range Low: -40°C; Category: IC; RoHS: TRUE; Automotive: No; Device Class L3: Shift Registers; Octopart: https://octopart.com/74hc165d%2C653-nexperia-78737091; Footprint Url: https://assets.nexperia.com/documents/outline-drawing/SOT109-1.pdf; Ambient Temperature Range Low: -40°C; Package: SOT109-1
R132-R139 = Resistor: RES 10K OHM 0.1% 1/8W 0805

## Sheet MUTE_BUTTONS_A.SchDoc
size A4; SheetNumber: 7; SheetTotal: 8
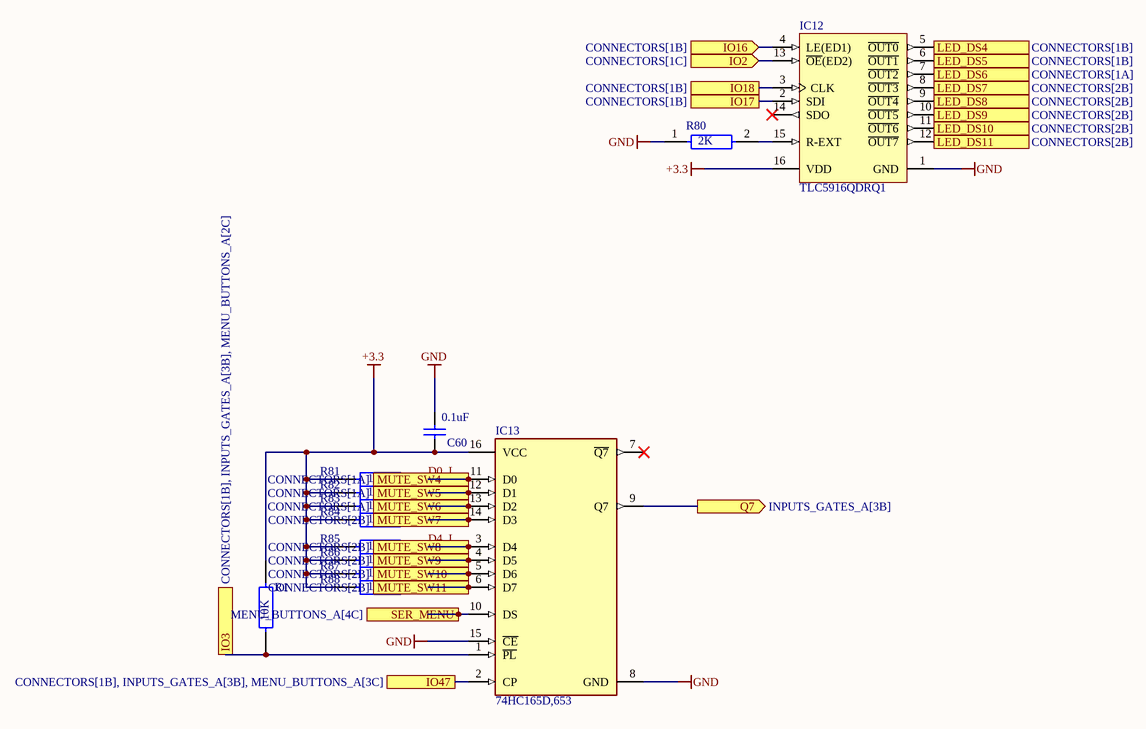
[diagram p6: MUTE_BUTTONS_A.SchDoc]

### Parts
C60  0.1uF  [CAPC2013X145X48NL20T23]
IC12  TLC5916QDRQ1  [D0016A_N]
IC13  74HC165D,653  [FP-SOT109-1-MFG]
R1  10K  [FP-RN73R2A-IPC_A]
R80  2K  [FP-RN73R2A-IPC_A]
R81  10K  [FP-RN73R2A-IPC_A]
R82  10K  [FP-RN73R2A-IPC_A]
R83  10K  [FP-RN73R2A-IPC_A]
R84  10K  [FP-RN73R2A-IPC_A]
R85  10K  [FP-RN73R2A-IPC_A]
R86  10K  [FP-RN73R2A-IPC_A]
R87  10K  [FP-RN73R2A-IPC_A]
R88  10K  [FP-RN73R2A-IPC_A]

### Ports
IO2 (in, see CONNECTORS[1C]), IO3 (see CONNECTORS[1B], INPUTS_GATES_A[3B], MENU_BUTTONS_A[2C]), IO16 (in, see CONNECTORS[1B]), IO17 (see CONNECTORS[1B]), IO18 (see CONNECTORS[1B]), IO47 (see CONNECTORS[1B], INPUTS_GATES_A[3B], MENU_BUTTONS_A[3C]), LED_DS4 (see CONNECTORS[1B]), LED_DS5 (see CONNECTORS[1B]), LED_DS6 (see CONNECTORS[1A]), LED_DS7 (see CONNECTORS[2B]), LED_DS8 (see CONNECTORS[2B]), LED_DS9 (see CONNECTORS[2B]), LED_DS10 (see CONNECTORS[2B]), LED_DS11 (see CONNECTORS[2B]), MUTE_SW4 (see CONNECTORS[1A]), MUTE_SW5 (see CONNECTORS[1A]), MUTE_SW6 (see CONNECTORS[1A]), MUTE_SW7 (see CONNECTORS[2B]), MUTE_SW8 (see CONNECTORS[2B]), MUTE_SW9 (see CONNECTORS[2B]), MUTE_SW10 (see CONNECTORS[2B]), MUTE_SW11 (see CONNECTORS[2B]), Q7 (out, see INPUTS_GATES_A[3B]), SER_MENU (in, see MENU_BUTTONS_A[4C])

### Nets
+3.3: C60.1 IC12.16(VDD) IC13.16(VCC) R1.2 R81.1 R82.1 R83.1 R84.1 R85.1 R86.1 R87.1 R88.1
GND: C60.2 IC12.1(GND) IC13.8(GND) IC13.15(~{CE}) R80.1
D0_L: IC13.11(D0) R81.2 ; port MUTE_SW4
D1_L: IC13.12(D1) R82.2 ; port MUTE_SW5
D2_L: IC13.13(D2) R83.2 ; port MUTE_SW6
D3_L: IC13.14(D3) R84.2 ; port MUTE_SW7
D4_L: IC13.3(D4) R85.2 ; port MUTE_SW8
D5_L: IC13.4(D5) R86.2 ; port MUTE_SW9
D6_L: IC13.5(D6) R87.2 ; port MUTE_SW10
D7_L: IC13.6(D7) R88.2 ; port MUTE_SW11
IO2: IC12.13(~{OE}(ED2)) ; port IO2
IO3: IC13.1(~{PL}) R1.1 ; port IO3
IO16: IC12.4(LE(ED1)) ; port IO16
IO17: IC12.2(SDI) ; port IO17
IO18: IC12.3(CLK) ; port IO18
IO47: IC13.2(CP) ; port IO47
LED_DS4: IC12.5(~{OUT0}) ; port LED_DS4
LED_DS5: IC12.6(~{OUT1}) ; port LED_DS5
LED_DS6: IC12.7(~{OUT2}) ; port LED_DS6
LED_DS7: IC12.8(~{OUT3}) ; port LED_DS7
LED_DS8: IC12.9(~{OUT4}) ; port LED_DS8
LED_DS9: IC12.10(~{OUT5}) ; port LED_DS9
LED_DS10: IC12.11(~{OUT6}) ; port LED_DS10
LED_DS11: IC12.12(~{OUT7}) ; port LED_DS11
Q7: IC13.9(Q7) ; port Q7
SER_MENU: IC13.10(DS) ; port SER_MENU
NetIC12_15: IC12.15(R-EXT) R80.2

Not connected (* = marked no-connect by the designer): IC12 14(SDO)*; IC13 7(~{Q7})*

### Library data of the parts
C60 = CAP: as C35 on sheet LFO_AMPS
IC12 = TLC5916: Automotive Catalog 8-Bit Constant-Current LED Sink Drivers, 3 to 5.5 V, -40 to 125 degC, 16-pin SOIC (D16), Green (RoHS & no Sb/Br); Manufacturer: Texas Instruments; SubFamily: LED Driver; Vin(Max)(V): 5.5; Vin(Min)(V): 3; Iout(Max)(A): 0.12; DatasheetVersion: SLVS814; Mounting Technology: Surface Mount; ComponentLink3Description: Package Specification; PartNumber: TLC5916QDRQ1; ComponentLink1Description: Manufacturer URL; Eco-Plan: Green (RoHS & no Sb/Br); Code_JEDEC: MS-012; ComponentLink2URL: http://www.ti.com/general/docs/lit/getliterature.tsp?genericPartNumber=TLC5916-Q1&fileType=pdf; PackageDescription: 16-Pin Plastic Small Outline, Body 9.90 x 3.90 mm, Pitch 1.27 mm; ComponentLink2Description: Datasheet; ComponentLink3URL: http://www.ti.com/litv/pdf/mpds178g; ComponentLink1URL: http://www.ti.com/; PackageVersion: 4040047-6/M; PackageReference: D0016A
IC13 = 74HC165: as IC6 on sheet INPUTS_GATES_A; Height: 1.75mm; Digikey Description: IC SHIFT REGST 8BIT PI-SO 16SOIC; ComponentLink2URL: https://assets.nexperia.com/documents/data-sheet/74HC_HCT165.pdf; Ipc Land Pattern Name: SOP127P600X175-16; Temperature Range High: +125°C; Manufacturer Part Number: 74HC165D,653; Temperature: -40°C to +125°C; Device Class L2: Logic ICs; Device Class L1: Integrated Circuits (ICs); Lead Free: Yes; Number Of Outputs: 1; Ambient Temperature Range High: +125°C; ComponentLink2Description: Datasheet; Temperature Range Low: -40°C; Category: IC; RoHS: TRUE; Automotive: No; Device Class L3: Shift Registers; Octopart: https://octopart.com/74hc165d%2C653-nexperia-78737091; Footprint Url: https://assets.nexperia.com/documents/outline-drawing/SOT109-1.pdf; Ambient Temperature Range Low: -40°C; Package: SOT109-1
R1 R80-R88 = Resistor: RES 10K OHM 0.1% 1/8W 0805

## Sheet ADC_A.SchDoc
size A4; SheetNumber: 8; SheetTotal: 8
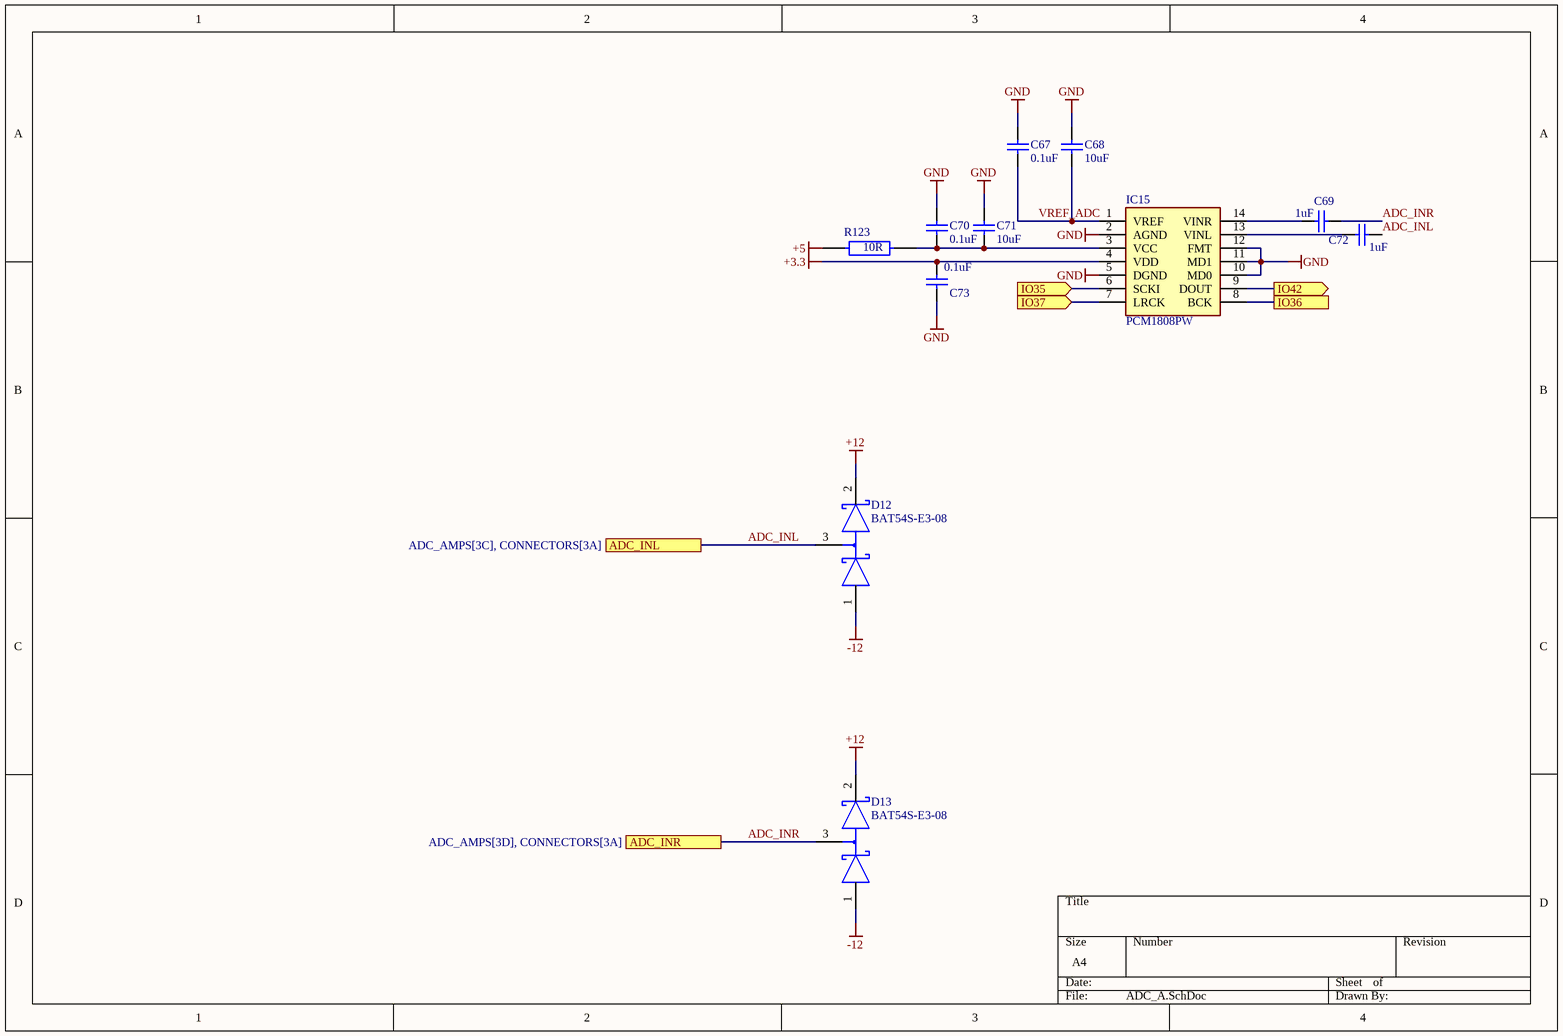
[diagram p7: ADC_A.SchDoc]

### Parts
C67  0.1uF  [CAPC2013X145X48NL20T23]
C68  10uF  [CAPC2013X145X48NL20T23]
C69  1uF  [CAPC2013X145X48NL20T23]
C70  0.1uF  [CAPC2013X145X48NL20T23]
C71  10uF  [CAPC2013X145X48NL20T23]
C72  1uF  [CAPC2013X145X48NL20T23]
C73  0.1uF  [CAPC2013X145X48NL20T23]
D12  BAT54S-E3-08  [FP-6_541-5014_01-4-IPC_A]
D13  BAT54S-E3-08  [FP-6_541-5014_01-4-IPC_A]
IC15  PCM1808PW  [SOP65P640X120-14N]
R123  10R  [FP-RN73R2A-IPC_A]

### Ports
ADC_INL (see ADC_AMPS[3C], CONNECTORS[3A]), ADC_INR (see ADC_AMPS[3D], CONNECTORS[3A]), IO35 (in), IO36, IO37 (in), IO42 (out)

### Nets
+3.3: C73.2 IC15.4(VDD)
+5: R123.2
+12: D12.2 D13.2
-12: D12.1 D13.1
GND: C67.1 C68.1 C70.1 C71.1 C73.1 IC15.2(AGND) IC15.5(DGND) IC15.10(MD0) IC15.11(MD1) IC15.12(FMT)
ADC_INL: C72.1 D12.3 ; port ADC_INL
ADC_INR: C69.1 D13.3 ; port ADC_INR
IO35: IC15.6(SCKI) ; port IO35
IO36: IC15.8(BCK) ; port IO36
IO37: IC15.7(LRCK) ; port IO37
IO42: IC15.9(DOUT) ; port IO42
VREF_ADC: C67.2 C68.2 IC15.1(VREF)
NetC69_2: C69.2 IC15.14(VINR)
NetC70_2: C70.2 C71.2 IC15.3(VCC) R123.1
NetC72_2: C72.2 IC15.13(VINL)

### Library data of the parts
C67-C73 = CAP: as C35 on sheet LFO_AMPS
D12 D13 = BAT54S: DIODE ARRAY SCHOTTKY 30V SOT23; Manufacturer: Vishay; Capacitance: 10pF; Forward Current: 200mA; Max Junction Temp: +125°C; Value: 10pF; Max Surge Forward Current: 600mA; Peak Reverse Current: 2uA; Temperature: -55°C to +125°C; Device Class L1: Discrete Semiconductors; Height: 1.15mm; ComponentLink2Description: Datasheet; Mouser Description: Schottky Diodes & Rectifiers 200mA 30 Volt; Max Repetitive Reverse Voltage: 30V; Manufacturer Part Number: BAT54S-E3-08; Package: 6.541-5014.01-4; Temperature Range High: +125°C; Digikey Description: DIODE ARRAY SCHOTTKY 30V SOT23; Device Class L2: Diodes; ComponentLink2URL: http://www.vishay.com/docs/85508/bat54.pdf; RoHS: TRUE; Octopart: https://octopart.com/bat54s-e3-08-vishay-29186616; Automotive: No; Lead Free: Yes; Category: Diode; Temperature Range Low: -55°C; Device Class L3: Schottky Diodes
IC15 = PCM1808PW: 99dB SNR Stereo ADC With Single-Ended Inputs; Manufacturer_Name: Texas Instruments; Geometry.Height: 1.2mm; Mouser Part Number: 595-PCM1808PW; Mouser Price/Stock: https://www.mouser.co.uk/ProductDetail/Texas-Instruments/PCM1808PW?qs=iSMark9AYDWYQaMpH%2FhwPg%3D%3D; Manufacturer_Part_Number: PCM1808PW; Datasheet Link: http://www.ti.com/lit/gpn/pcm1808
R123 = Resistor: RES 10K OHM 0.1% 1/8W 0805

## Nets that join several sheets
+3.3: CONNECTORS (H1.39), INPUTS_GATES_A (10 pins), MENU_BUTTONS_A (10 pins), MUTE_BUTTONS_A (12 pins), ADC_A (C73.2 IC15.4)
+5: CONNECTORS (H1.35), ADC_A (R123.2)
+12: LFO_AMPS (6 pins), VOCT_AMPS (C30.2 C58.2 IC5.4), ADC_AMPS (C74.1 C75.1 IC16.8), CONNECTORS (H1.1 H2.1), ADC_A (D12.2 D13.2)
-12: LFO_AMPS (6 pins), VOCT_AMPS (C31.2 C59.2 IC5.11), ADC_AMPS (C76.1 C77.1 IC16.4), CONNECTORS (H1.3 H2.3), ADC_A (D12.1 D13.1)
GND: LFO_AMPS (12 pins), VOCT_AMPS (6 pins), ADC_AMPS (6 pins), CONNECTORS (16 pins), INPUTS_GATES_A (27 pins), MENU_BUTTONS_A (C87.2 IC17.8 IC17.10 IC17.15), MUTE_BUTTONS_A (5 pins), ADC_A (10 pins)
VREF_5: LFO_AMPS (R60.1 R62.1 R72.1 R74.1), CONNECTORS (H1.4 H2.5)
ADC_INL: ADC_AMPS (R127.2), ADC_A (C72.1 D12.3)
ADC_INR: ADC_AMPS (R131.2), ADC_A (C69.1 D13.3)
D0_L: CONNECTORS (H1.20), MUTE_BUTTONS_A (IC13.11 R81.2)
D0_M: CONNECTORS (H2.37), MENU_BUTTONS_A (IC17.11 R132.2)
D1_L: CONNECTORS (H1.19), MUTE_BUTTONS_A (IC13.12 R82.2)
D1_M: CONNECTORS (H2.36), MENU_BUTTONS_A (IC17.12 R133.2)
D2_L: CONNECTORS (H1.18), MUTE_BUTTONS_A (IC13.13 R83.2)
D3_L: CONNECTORS (H2.25), MUTE_BUTTONS_A (IC13.14 R84.2)
D4_L: CONNECTORS (H2.26), MUTE_BUTTONS_A (IC13.3 R85.2)
D5_L: CONNECTORS (H2.27), MUTE_BUTTONS_A (IC13.4 R86.2)
D6_L: CONNECTORS (H2.28), MUTE_BUTTONS_A (IC13.5 R87.2)
D7_L: CONNECTORS (H2.29), MUTE_BUTTONS_A (IC13.6 R88.2)
GATE_J2: CONNECTORS (H1.15), INPUTS_GATES_A (R28.1)
GATE_J3: CONNECTORS (H1.16), INPUTS_GATES_A (R29.1)
GATE_J4: CONNECTORS (H1.17), INPUTS_GATES_A (R39.1)
GATE_J5: CONNECTORS (H2.22), INPUTS_GATES_A (R41.1)
GATE_J6: CONNECTORS (H2.21), INPUTS_GATES_A (R44.1)
GATE_J7: CONNECTORS (H2.20), INPUTS_GATES_A (R45.1)
GATE_J8: CONNECTORS (H2.19), INPUTS_GATES_A (R48.1)
GATE_J9: CONNECTORS (H2.18), INPUTS_GATES_A (R49.1)
IN_J26: ADC_AMPS (R126.1), CONNECTORS (H2.7)
IN_J28: ADC_AMPS (R130.1), CONNECTORS (H2.6)
IO2: CONNECTORS (H1.38), MUTE_BUTTONS_A (IC12.13)
IO3: CONNECTORS (H1.37), INPUTS_GATES_A (IC6.1), MENU_BUTTONS_A (IC17.1), MUTE_BUTTONS_A (IC13.1 R1.1)
IO16: CONNECTORS (H3.5), MUTE_BUTTONS_A (IC12.4)
IO17: CONNECTORS (H3.4), MUTE_BUTTONS_A (IC12.2)
IO18: CONNECTORS (H3.2), MUTE_BUTTONS_A (IC12.3)
IO35: CONNECTORS (H3.9), ADC_A (IC15.6)
IO36: CONNECTORS (H3.10), ADC_A (IC15.8)
IO37: CONNECTORS (H3.11), ADC_A (IC15.7)
IO42: CONNECTORS (H3.12), ADC_A (IC15.9)
IO47: CONNECTORS (H3.6), INPUTS_GATES_A (IC6.2), MENU_BUTTONS_A (IC17.2), MUTE_BUTTONS_A (IC13.2)
IO48: CONNECTORS (H3.7), INPUTS_GATES_A (IC6.9)
LED_DS4: CONNECTORS (H1.23), MUTE_BUTTONS_A (IC12.5)
LED_DS5: CONNECTORS (H1.22), MUTE_BUTTONS_A (IC12.6)
LED_DS6: CONNECTORS (H1.21), MUTE_BUTTONS_A (IC12.7)
LED_DS7: CONNECTORS (H2.30), MUTE_BUTTONS_A (IC12.8)
LED_DS8: CONNECTORS (H2.31), MUTE_BUTTONS_A (IC12.9)
LED_DS9: CONNECTORS (H2.32), MUTE_BUTTONS_A (IC12.10)
LED_DS10: CONNECTORS (H2.33), MUTE_BUTTONS_A (IC12.11)
LED_DS11: CONNECTORS (H2.34), MUTE_BUTTONS_A (IC12.12)
LED_Q10: LFO_AMPS (R96.1), CONNECTORS (H1.12)
LED_Q11: LFO_AMPS (R97.1), CONNECTORS (H1.14)
LED_Q12: LFO_AMPS (R102.1), CONNECTORS (H1.13)
LED_Q13: LFO_AMPS (R103.1), CONNECTORS (H2.17)
LED_Q14: LFO_AMPS (R108.1), CONNECTORS (H2.16)
LED_Q15: LFO_AMPS (R109.1), CONNECTORS (H2.14)
LED_Q16: LFO_AMPS (R114.1), CONNECTORS (H2.15)
LED_Q17: LFO_AMPS (R115.1), CONNECTORS (H2.13)
OUT_J10: LFO_AMPS (R55.2), CONNECTORS (H1.9)
OUT_J11: LFO_AMPS (R57.2), CONNECTORS (H2.11)
OUT_J12: LFO_AMPS (R61.2), CONNECTORS (H1.11)
OUT_J13: LFO_AMPS (R63.2), CONNECTORS (H2.9)
OUT_J14: LFO_AMPS (R67.2), CONNECTORS (H1.10)
OUT_J15: LFO_AMPS (R69.2), CONNECTORS (H2.10)
OUT_J16: LFO_AMPS (R73.2), CONNECTORS (H2.12)
OUT_J17: LFO_AMPS (R75.2), CONNECTORS (H2.8)
OUT_J22: VOCT_AMPS (R22.1 R26.1), CONNECTORS (H1.5)
OUT_J23: VOCT_AMPS (R21.1 R27.1), CONNECTORS (H1.6)
Q7: INPUTS_GATES_A (IC6.10), MUTE_BUTTONS_A (IC13.9)
SER_MENU: MENU_BUTTONS_A (IC17.9), MUTE_BUTTONS_A (IC13.10)
VOCT_A: VOCT_AMPS (IC5.5), CONNECTORS (H1.32)
VOCT_B: VOCT_AMPS (IC5.10), CONNECTORS (H1.33)
VOUT_REF: VOCT_AMPS (R23.1 R25.2), CONNECTORS (H1.7)
VOUTA: LFO_AMPS (IC8.3), CONNECTORS (H1.24)
VOUTA2: LFO_AMPS (IC9.3), CONNECTORS (H1.28)
VOUTB: LFO_AMPS (IC8.5), CONNECTORS (H1.25)
VOUTB2: LFO_AMPS (IC9.5), CONNECTORS (H1.29)
VOUTC: LFO_AMPS (IC8.10), CONNECTORS (H1.26)
VOUTC2: LFO_AMPS (IC9.10), CONNECTORS (H1.30)
VOUTD: LFO_AMPS (IC8.12), CONNECTORS (H1.27)
VOUTD2: LFO_AMPS (IC9.12), CONNECTORS (H1.31)
VREF: VOCT_AMPS (IC5.3), CONNECTORS (H1.34)
VREF_BUF: VOCT_AMPS (IC5.1 R24.1), CONNECTORS (H1.8)